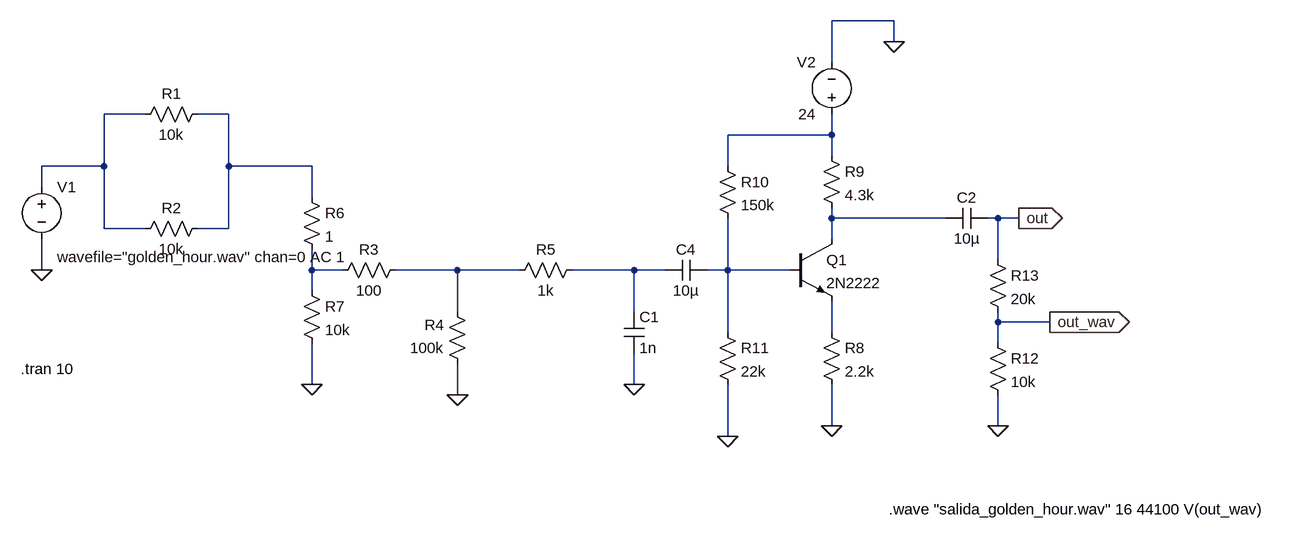
[diagram p0: schematic Preamplificacion_LTspice.asc]
Preamplificacion_LTspice.asc, the LTspice schematic file:
Version 4.1
SHEET 1 1756 768
WIRE 1120 0 1024 0
WIRE 1120 32 1120 0
WIRE 1024 64 1024 0
WIRE -32 144 -96 144
WIRE 96 144 48 144
WIRE 1024 176 1024 144
WIRE 1024 176 864 176
WIRE 1024 208 1024 176
WIRE -96 224 -96 144
WIRE -96 224 -192 224
WIRE 96 224 96 144
WIRE 224 224 96 224
WIRE 864 224 864 176
WIRE -192 256 -192 224
WIRE 224 272 224 224
WIRE 1024 304 1024 288
WIRE 1200 304 1024 304
WIRE 1280 304 1264 304
WIRE 1312 304 1280 304
WIRE -96 320 -96 224
WIRE -32 320 -96 320
WIRE 96 320 96 224
WIRE 96 320 48 320
WIRE 1024 336 1024 304
WIRE 1280 368 1280 304
WIRE -192 384 -192 336
WIRE 224 384 224 352
WIRE 272 384 224 384
WIRE 448 384 352 384
WIRE 544 384 448 384
WIRE 720 384 624 384
WIRE 768 384 720 384
WIRE 864 384 864 304
WIRE 864 384 832 384
WIRE 960 384 864 384
WIRE 224 416 224 384
WIRE 448 448 448 384
WIRE 720 448 720 384
WIRE 1280 464 1280 448
WIRE 1360 464 1280 464
WIRE 864 480 864 384
WIRE 1024 480 1024 432
WIRE 1280 496 1280 464
WIRE 224 560 224 496
WIRE 720 560 720 512
WIRE 448 576 448 528
WIRE 1024 624 1024 560
WIRE 1280 624 1280 576
WIRE 864 640 864 560
FLAG 448 576 0
FLAG 720 560 0
FLAG -192 384 0
FLAG 224 560 0
FLAG 1024 624 0
FLAG 1120 32 0
FLAG 864 640 0
FLAG 1280 624 0
FLAG 1312 304 out
IOPIN 1312 304 Out
FLAG 1360 464 out_wav
IOPIN 1360 464 Out
SYMBOL res 64 128 R90
WINDOW 0 0 56 VBottom 2
WINDOW 3 32 56 VTop 2
SYMATTR InstName R1
SYMATTR Value 10k
SYMBOL res 64 304 R90
WINDOW 0 0 56 VBottom 2
WINDOW 3 32 56 VTop 2
SYMATTR InstName R2
SYMATTR Value 10k
SYMBOL res 368 368 R90
WINDOW 0 0 56 VBottom 2
WINDOW 3 32 56 VTop 2
SYMATTR InstName R3
SYMATTR Value 100
SYMBOL res 464 544 R180
WINDOW 0 36 76 Left 2
WINDOW 3 36 40 Left 2
SYMATTR InstName R4
SYMATTR Value 100k
SYMBOL res 640 368 R90
WINDOW 0 0 56 VBottom 2
WINDOW 3 32 56 VTop 2
SYMATTR InstName R5
SYMATTR Value 1k
SYMBOL cap 704 448 R0
SYMATTR InstName C1
SYMATTR Value 1n
SYMBOL voltage -192 240 R0
WINDOW 123 24 124 Left 2
WINDOW 39 0 0 Left 0
SYMATTR Value2 wavefile="golden_hour.wav" chan=0 AC 1
SYMATTR InstName V1
SYMATTR Value ""
SYMBOL res 208 256 R0
SYMATTR InstName R6
SYMATTR Value 1
SYMBOL res 208 400 R0
SYMATTR InstName R7
SYMATTR Value 10k
SYMBOL npn 960 336 R0
SYMATTR InstName Q1
SYMATTR Value 2N2222
SYMBOL res 1008 464 R0
SYMATTR InstName R8
SYMATTR Value 2.2k
SYMBOL res 1008 192 R0
SYMATTR InstName R9
SYMATTR Value 4.3k
SYMBOL cap 1264 288 R90
WINDOW 0 0 32 VBottom 2
WINDOW 3 32 32 VTop 2
SYMATTR InstName C2
SYMATTR Value 10µ
SYMBOL voltage 1024 160 R180
WINDOW 0 24 96 Left 2
WINDOW 3 24 16 Left 2
WINDOW 123 0 0 Left 0
WINDOW 39 0 0 Left 0
SYMATTR InstName V2
SYMATTR Value 24
SYMBOL res 848 208 R0
SYMATTR InstName R10
SYMATTR Value 150k
SYMBOL cap 832 368 R90
WINDOW 0 0 32 VBottom 2
WINDOW 3 32 32 VTop 2
SYMATTR InstName C4
SYMATTR Value 10µ
SYMBOL res 848 464 R0
SYMATTR InstName R11
SYMATTR Value 22k
SYMBOL res 1264 480 R0
SYMATTR InstName R12
SYMATTR Value 10k
SYMBOL res 1264 352 R0
SYMATTR InstName R13
SYMATTR Value 20k
TEXT -224 536 Left 2 !.tran 10
TEXT 1112 752 Left 2 !.wave "salida_golden_hour.wav" 16 44100 V(out_wav)

The netlist it stands for:
* Preamplificacion_LTspice.asc
R1 N002 N001 10k
R2 N002 N001 10k
R3 N006 N005 100
R4 0 N006 100k
R5 N007 N006 1k
C1 N007 0 1n
V1 N001 0 wavefile="golden_hour.wav" chan=0 AC 1
R6 N002 N005 1
R7 N005 0 10k
Q1 N004 N008 N009 0 2N2222
R8 N009 0 2.2k
R9 N003 N004 4.3k
C2 out N004 10µ
V2 N003 0 24
R10 N003 N008 150k
C4 N008 N007 10µ
R11 N008 0 22k
R12 out_wav 0 10k
R13 out out_wav 20k
.model NPN NPN
.model PNP PNP
.lib standard.bjt
.tran 10
.wave "salida_golden_hour.wav" 16 44100 V(out_wav)
.backanno
.end